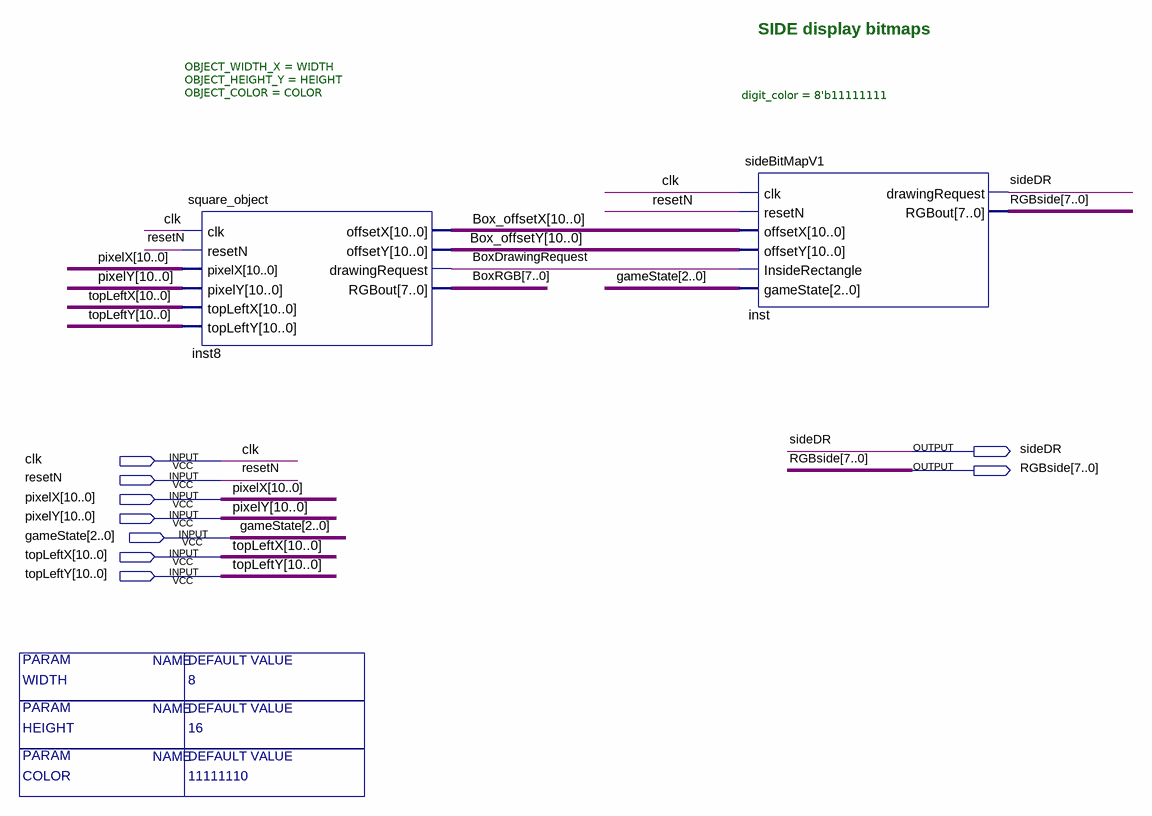
[diagram p0: schematic sheet]
// Quartus schematic sideBitMapTop.bdf as structural Verilog: 2 symbols, 9 pins
module sideBitMapTop #(parameter COLOR = 11111110, parameter WIDTH = 8, parameter HEIGHT = 16) (
  input  clk,
  input  resetN,
  input  [10:0] pixelX,
  input  [10:0] pixelY,
  input  [2:0] gameState,
  input  [10:0] topLeftX,
  input  [10:0] topLeftY,
  output sideDR,
  output [7:0] RGBside
);

  wire BoxDrawingRequest;
  wire [7:0] BoxRGB;
  wire [10:0] Box_offsetX, Box_offsetY;

  square_object #(.OBJECT_WIDTH_X(WIDTH), .OBJECT_HEIGHT_Y(HEIGHT), .OBJECT_COLOR(COLOR)) inst8 (
    .clk(clk), .resetN(resetN), .pixelX(pixelX), .pixelY(pixelY), .topLeftX(topLeftX), .topLeftY(topLeftY),
    .offsetX(Box_offsetX), .offsetY(Box_offsetY), .drawingRequest(BoxDrawingRequest), .RGBout(BoxRGB));
  sideBitMapV1 #(.digit_color(8'b11111111)) inst (
    .clk(clk), .resetN(resetN), .offsetX(Box_offsetX), .offsetY(Box_offsetY),
    .InsideRectangle(BoxDrawingRequest), .gameState(gameState), .drawingRequest(sideDR), .RGBout(RGBside));

  // Notes on the sheet:
  //   SIDE display bitmaps
endmodule
